# Altium schematic sheet Connector_Sheet.SchDoc
size A4; DocumentNumber: 1; SheetNumber: 1; SheetTotal: 1
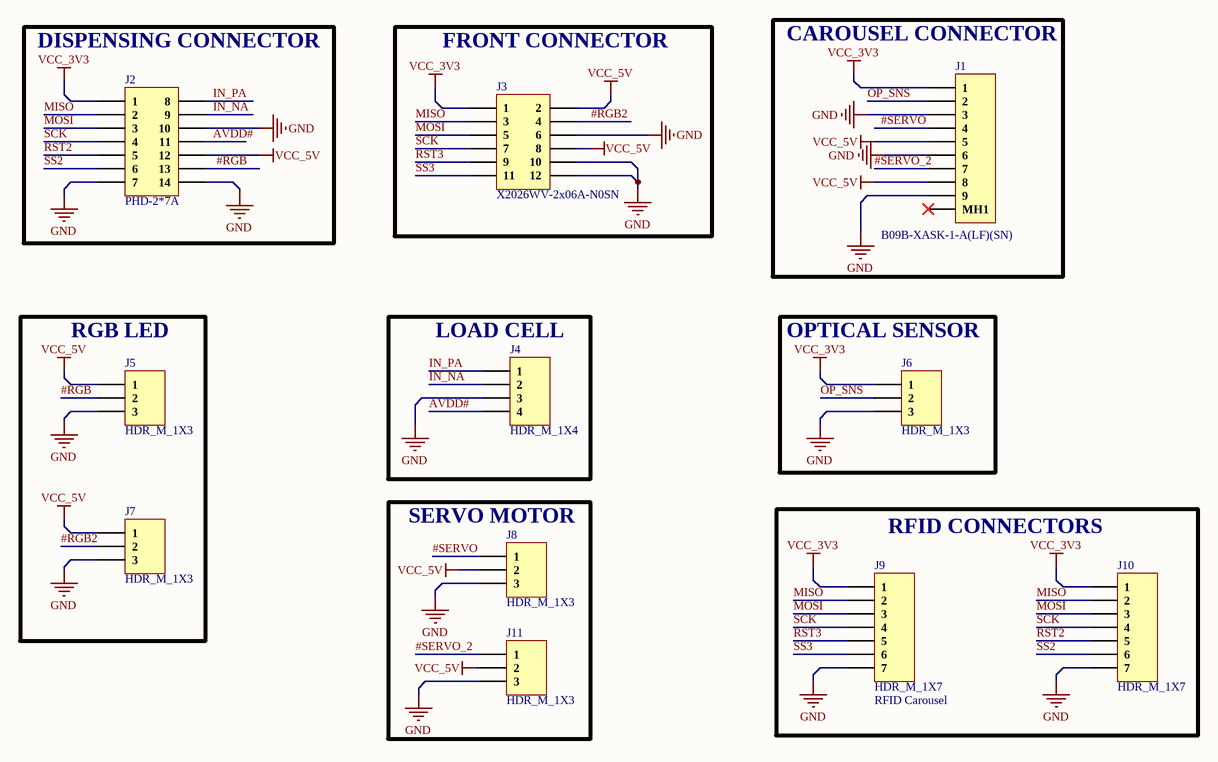
[diagram p0: Connector_Sheet.SchDoc]

## Parts
J1  B09B-XASK-1-A(LF)(SN)  [B09B-XASK-1-A(LF)(SN)]
J2  PHD-2*7A  [PHD-2*7A]
J3  X2026WV-2x06A-N0SN  [X2026WV-2x06A-N0SN]
J4  HDR_M_1X4  [HDR_M_1X4]
J5  HDR_M_1X3  [HDR_M_1X3]
J6  HDR_M_1X3  [HDR_M_1X3]
J7  HDR_M_1X3  [HDR_M_1X3]
J8  HDR_M_1X3  [HDR_M_1X3]
J9  HDR_M_1X7  [HDR_M_1X7]
J10  HDR_M_1X7  [HDR_M_1X7]
J11  HDR_M_1X3  [HDR_M_1X3]

## Blocks framed on the sheet
DISPENSING CONNECTOR: J2
FRONT CONNECTOR: J3
CAROUSEL CONNECTOR: J1
RGB LED: J5 J7
LOAD CELL: J4
OPTICAL SENSOR: J6
SERVO MOTOR: J8 J11
RFID CONNECTORS: J9 J10

## Nets
GND: J1.3 J1.6 J1.9 J2.7 J2.10 J2.14 J3.6 J3.10 J3.12 J4.3 J5.3 J6.3 J7.3 J8.3 J9.7 J10.7 J11.3
VCC_3V3: J1.1 J2.1 J3.1 J6.1 J9.1 J10.1
VCC_5V: J1.5 J1.8 J2.12 J3.2 J3.8 J5.1 J7.1 J8.2 J11.2
#RGB: J2.13 J5.2
#RGB2: J3.4 J7.2
#SERVO: J1.4 J8.1
#SERVO_2: J1.7 J11.1
AVDD#: J2.11 J4.4
IN_NA: J2.9 J4.2
IN_PA: J2.8 J4.1
MISO: J2.2 J3.3 J9.2 J10.2
MOSI: J2.3 J3.5 J9.3 J10.3
OP_SNS: J1.2 J6.2
RST2: J2.5 J10.5
RST3: J3.9 J9.5
SCK: J2.4 J3.7 J9.4 J10.4
SS2: J2.6 J10.6
SS3: J3.11 J9.6

Not connected (* = marked no-connect by the designer): J1 MH1*

## Notes on the sheet
- (near J9) RFID Carousel
- 1
- Huzaifa Ali

## Library data of the parts
J1 = B09B-XASK-1-A(LF)(SN): CONN HEADER VERT 9POS 2.5MM; Manufacturer: JST; Shape: Straight; Number of Poles: 9; Current Rating: 3A; Supplier 1: Digi-Key; Manufacturer Part Number: B09B-XASK-1-A(LF)(SN); RoHS: Yes; Category: Connectors; Pricing 1: 1=0.50000, 10=0.43900, 100=0.36160, 500=0.31446, 1000=0.25942, 5000=0.22798, 10000=0.21226 (USD); Contact Plating: Copper,Tin,Lead; Min Operating Temperature: -25°C; Max Operating Temperature: 85°C; Length: 25mm; Width: 6.4mm; Height: 8.8mm; Pitch: 2.5mm; Supplier Part Number 1: 455-4123-ND
J2 = PHD-2*7A: 2x7P 2 PHD 2mm 2mm 7 Phosphor bronze Plugin,P=2mm Wire To Board / Wire To Wire Connector ROHS; Manufacturer: BOOMELE; ComponentLink1Description: LCSC; ComponentLink1URL: https://lcsc.com/product-detail/Wire-To-Board-Wire-To-Wire-span-style-background-color-ff0-Connector-span_BOOMELE-Boom-Precision-Elec-PHD-2-7A_C40745.html; Manufacturer Part No: PHD-2*7A; Package: Custom
J3 = X2026WV-2x06A-N0SN: 2x6P 2 2mm 2mm 6 Brass Plugin,P=2mm Wire To Board / Wire To Wire Connector ROHS; Manufacturer: XKB-Connectivity; ComponentLink1Description: LCSC; ComponentLink1URL: https://lcsc.com/product-detail/Wire-To-Board-Wire-To-Wire-span-style-background-color-ff0-Connector-span_XKB-Connectivity-X2026WV-2x06A-N0SN_C725844.html; Manufacturer Part No: X2026WV-2x06A-N0SN; Package: Custom
J4 = HDR_M_1X4: 4 POS 2.54mm spacer header; Manufacturer: E-SIMPO; Current Rating: 1Amps; Pitch: 2.54mm; ComponentLink1Description: AliE; ComponentLink1URL: c
J5-J8 J11 = HDR_M_1X3: 3 POS 2.54mm spacer header; Manufacturer: E-SIMPO; Current Rating: 1Amps; Pitch: 2.54mm; ComponentLink1Description: AliE; ComponentLink1URL: https://www.aliexpress.com/item/32896225776.html?spm=a2g0o.productlist.0.0.64116a18Q9OFX2&algo_pvid=aef74b9f-f029-40ba-a87b-4c3df7d87b26&algo_exp_id=aef74b9f-f029-40ba-a87b-4c3df7d87b26-3&pdp_ext_f=%7B%22sku_id%22%3A%2265850500267%22%7D&pdp_pi=-1%3B2.79%3B-1%3BUSD+3.72%40salePrice%3BUSD%3Bsearch-mainSearch
J9 J10 = HDR_M_1X7: 7 POS 2.54mm Board Spacer Pin; Manufacturer: E-SIMPO; Current Rating: 1Amps; Pitch: 2.54mm; ComponentLink1Description: AliE; ComponentLink1URL: https://www.aliexpress.com/item/32896225776.html?spm=a2g0o.productlist.0.0.64116a18Q9OFX2&algo_pvid=aef74b9f-f029-40ba-a87b-4c3df7d87b26&algo_exp_id=aef74b9f-f029-40ba-a87b-4c3df7d87b26-3&pdp_ext_f=%7B%22sku_id%22%3A%2265850500267%22%7D&pdp_pi=-1%3B2.79%3B-1%3BUSD+3.72%40salePrice%3BUSD%3Bsearch-mainSearch